# EasyEDA Pro project esp-college-project_bkymsryt-aeef78a5.epro, board PCB-ESP-SensairShuttle-MainBoard-V1_1
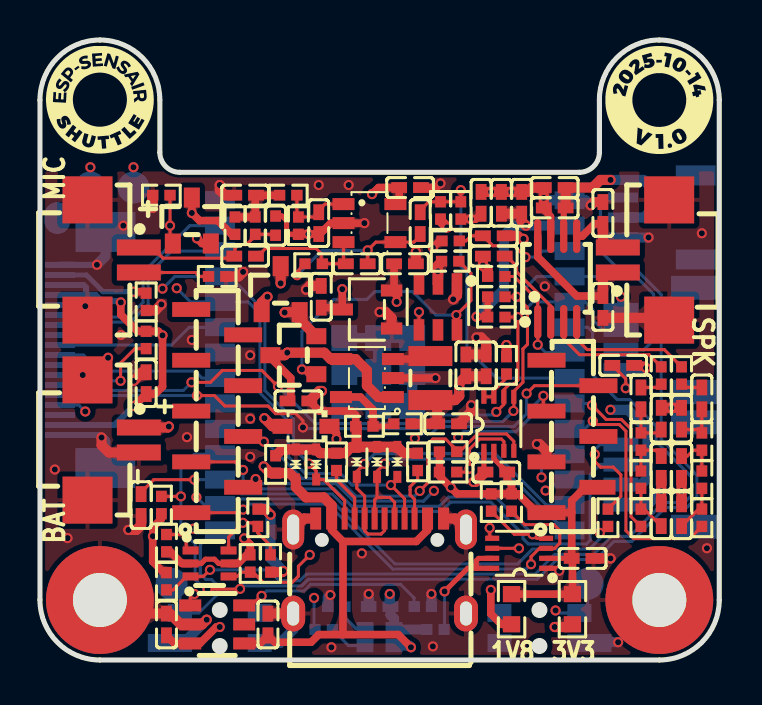
[diagram p7: board, top side]
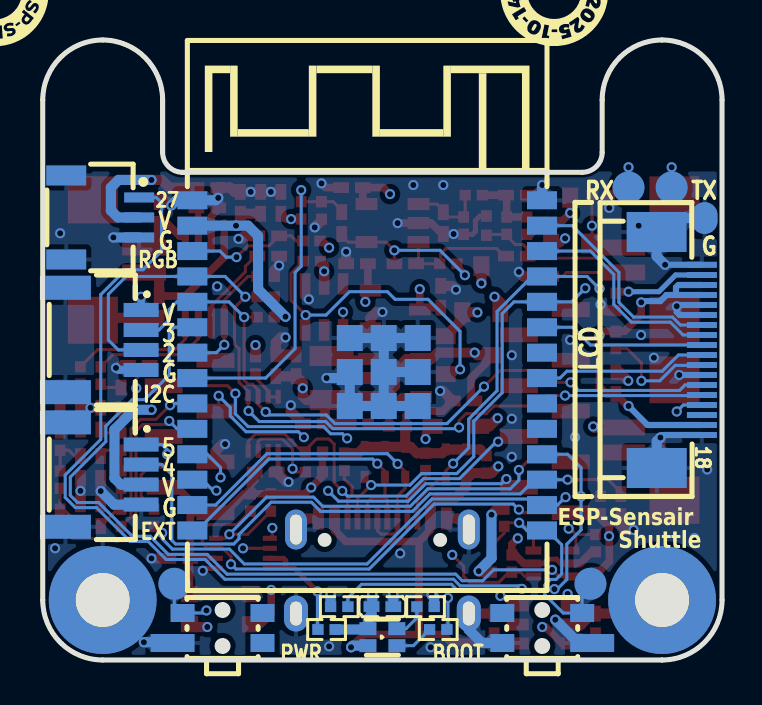
[diagram p8: board, bottom side, seen from below]

Outline 34 x 31 mm; copper layers: Top Layer, GND, POWER, Bottom Layer. Coordinates in mm from the lower left corner of the outline.
Outline path: 0,28 0,3 arc(0.88,0.88) 3,0 31,0 arc(33.12,0.88) 34,3 34,28 arc(33.12,30.12) 31,31 arc(28.88,30.12) 28,28 28,25.38 arc(27.71,24.68) 27,24.38 7,24.38 arc(6.29,24.68) 6,25.38 6,28 arc(5.12,30.12) 3,31 arc(0.88,30.12) 0,28
Stack: Top Layer 0.035mm 外层铜厚1oz / Dielectric1 0.28mm 7628 RC49% 8.6mil / GND 0.035mm 内层铜厚 / Dielectric2 0.28mm 1.1mm H/HOZ Copper / POWER 0.035mm 内层铜厚 / Dielectric3 0.28mm 7628 RC49% 8.6mil / Bottom Layer 0.035mm 外层铜厚1oz

## Design rules (mm)
spacing copperThickness1oz (default): track to track 0.102, other pairs 0.152 to 0.3
spacing copperThickness2oz: track to track 0.203, other pairs 0.152 to 0.3
spacing Plane_innerPlane: track to track 0.102, other pairs 0.152 to 0.3
spacing Copper_copperRegion: track to track 0.102, other pairs 0.152 to 0.3
track width copperThickness1oz (default): min 0.127, default 0.152, max 2.54
track width copperThickness2oz: min 0.203, default 0.254, max 2.54
track width power: min 0.127, default 0.381, max 2.54
track width maxpower: min 0.254, default 0.508, max 2.54
differential pair differentialPair (default): width min 0.127, default 0.254, max 2.54; gap min 0.152, default 0.152
net GND uses copperRegion_copperThickness1oz, maxpower
net VBUS uses maxpower
net VCC_3V3 uses maxpower
net VCC_1V8 uses power
net VDD_SENSOR uses power
net MIC_3V3 uses maxpower
net LEDK uses power
net VIN uses maxpower
net VBAT_IN uses maxpower
net AUDIO_3V3 uses power
net VOUT uses power
pour e1780 uses Copper_copperRegion, copperRegion_Copper_copperRegion
pour e1885 uses Copper_copperRegion, copperRegion_Copper_copperRegion
pour e1979 uses Copper_copperRegion, copperRegion_Copper_copperRegion
pour e2000 uses Copper_copperRegion, copperRegion_Copper_copperRegion

## Placement (name value [footprint] x y rotation side)
C1  15pF  [C0402]  15.86 19.81 0 top
C2  100nF  [C0402]  22.08 22.86 90 top
C3  100nF  [C0402]  18.52 23.62 0 top
C4  10uF  [C0402]  10.27 23.24 0 top
C5  4.7uF  [C0402]  13.95 21.84 90 top
C6  2.2uF  [C0402]  10.27 20.19 0 top
C7  4.7uF  [C0402]  19.03 21.84 270 top
C8  10uF  [C0402]  23.1 22.86 90 top
C9  100nF  [C0402]  24.11 22.86 270 top
C10  22pF  [C0402_1]  11.79 21.72 270 top
C11  1uF  [C0402]  22.72 21.21 0 top
C12  4.7nF  [C0402]  31.1 7.24 270 top
C13  2.2nF  [C0402]  31.1 9.65 90 top
C14  1nF  [C0402]  31.1 12.06 270 top
C15  1nF  [C0402]  28.18 17.65 270 top
C16  4.7nF  [C0402]  32.11 7.24 90 top
C17  2.2nF  [C0402]  32.11 9.65 270 top
C18  1nF  [C0402]  32.11 12.06 90 top
C19  1nF  [C0402]  28.18 22.35 270 top
C20  100nF  [C0402]  30.08 13.08 90 top
C21  1uF  [C0402]  22.72 20.19 0 top
C22  100nF  [C0402]  33.13 13.08 90 top
C23  100nF  [C0402]  25.76 22.61 0 top
C24  1uF  [C0402]  25.76 23.62 0 top
C26  10uF  [C0402]  21.32 14.73 270 top
C27  100nF  [C0402]  20.43 11.81 180 top
C28  10uF  [C0402]  14.08 18.16 270 top
C29  10uF  [C0402]  18.27 19.81 180 top
C30  100nF  [C0402]  22.33 14.73 270 top
C31  100nF  [C0402]  5.32 13.84 270 top
C32  10uF  [C0402]  6.33 1.78 270 top
C33  10uF  [C0402]  11.41 1.78 270 top
C34  100nF  [C0402]  22.84 9.4 0 top
C35  100nF  [C0402]  17 2.67 0 bottom
C36  100nF  [C0402]  27.16 5.08 180 top
C37  100nF  [C0402]  29.19 14.73 180 top
C38  100nF  [C0402]  5.06 7.75 90 top
C39  10uF  [C0402]  12.94 12.95 180 top
CN1  HC-1.25-2PWT  [CONN-SMD_2P-P1.25-HC-1.25-2PWT]  3.66 20 270 top
CN2  HC-1.25-2PWT  [CONN-SMD_2P-P1.25-HC-1.25-2PWT]  30.21 20 90 top
CN3  X1311FVS-09-C43D35R1  [HDR-SMD_9P-P1.27-V-F_R1]  8.87 12.45 90 top
CN4  HC-1.0-4PWT  [CONN-SMD_4P-P1.00_HCTL_HC-1.0-4PWT]  30.97 9.27 270 bottom
CN5  HC-1.0-4PWT  [CONN-SMD_4P-P1.00_HCTL_HC-1.0-4PWT]  30.97 16 270 bottom
CN6  HC-1.0-3PWT  [CONN-SMD_3P-P1.0-HC-1.0-3PWT]  31 22.13 270 bottom
CN7  HC-1.25-2PWT  [CONN-SMD_2P-P1.25-HC-1.25-2PWT]  3.66 11 270 top
D1  LESD5D5.0CT1G  [SOD-523_L1.2-W0.8-LS1.6-BI]  12.81 9.78 270 top
D2  LESD5D5.0CT1G  [SOD-523_L1.2-W0.8-LS1.6-BI]  16.87 9.91 270 top
D4  1N5819WS  [SOD-323_L1.8-W1.3-LS2.5-RD]  13.32 11.68 180 top
D5  LESD5D5.0CT1G  [SOD-523_L1.2-W0.8-LS1.6-BI]  15.86 9.91 270 top
D6  LESD5D5.0CT1G  [SOD-523_L1.2-W0.8-LS1.6-BI]  17.89 9.91 270 top
D7  LESD5D5.0CT1G  [SOD-523_L1.2-W0.8-LS1.6-BI]  13.82 9.78 270 top
L1  2.2uH  [IND-SMD_L2.5-W2.0_MHCHL2520]  19.54 14.1 90 top
LED1  A-SP1942R6GHC-A01-2T  [LED-SMD_4P-L1.6-W1.5_F.1615.00003-P4-1615R1G1TA2-06T-001]  17 1.14 0 bottom
NOREF  -  [Pad_e151]  27.41 3.81 0 top
NOREF#2  -  [Pad_e155]  0.87 22.1 0 top
NOREF#3  -  [Pad_e153]  2.52 23.62 0 top
NOREF#4  -  [Pad_e149]  3 3 0 top
NOREF#5  -  [Pad_e152]  6.59 3.81 0 top
NOREF#6  -  [Pad_e150]  31 3 0 top
NOREF#7  -  [Pad_e154]  4.68 23.62 0 top
Q1  AO3401A  [SOT-23_L2.9-W1.3-P1.90-LS2.4-BR]  12.05 18.54 270 top
Q2  AO3401A  [SOT-23_L2.9-W1.3-P1.90-LS2.4-BR]  7.6 21.97 270 top
Q3  LBSS138DW1T1G  [SC-88-6_L2.0-W1.3-P0.65-LS2.1-BL]  8.49 4.83 270 top
Q4  AO3401A  [SOT-23_L2.9-W1.3-P1.90-LS2.4-BR]  12.68 15.24 0 top
R1  2.2kΩ  [R0402]  22.84 17.14 0 top
R2  2.2kΩ  [R0402]  22.84 18.16 0 top
R3  100kΩ  [R0402_1]  12.43 23.24 0 top
R4  150kΩ  [R0402]  13.7 19.81 180 top
R5  56kΩ  [R0402]  21.06 22.48 270 top
R6  1.5kΩ  [R0402]  9.76 21.72 90 top
R7  2.2kΩ  [R0402]  10.78 21.72 90 top
R8  100kΩ  [R0402_1]  12.94 21.72 90 top
R9  8.2kΩ  [R0402]  20.05 22.48 90 top
R10  0Ω  [R0402_1]  8.87 19.18 180 top
R11  10kΩ  [R0402_1]  6.08 7.75 90 top
R12  10kΩ  [R0402_1]  10.9 7.11 270 top
R13  10kΩ  [R0402_1]  20.56 20.95 0 top
R14  0Ω(NC)  [R0402_1]  28.43 7.11 90 top
R15  1kΩ  [R0402]  30.08 7.11 90 top
R16  1kΩ  [R0402]  30.08 9.02 90 top
R17  1kΩ  [R0402]  30.08 10.92 90 top
R18  1kΩ  [R0402]  33.13 7.11 90 top
R19  1kΩ  [R0402]  33.13 9.02 90 top
R20  1kΩ  [R0402]  33.13 10.92 90 top
R21  10kΩ  [R0402_1]  22.84 19.18 0 top
R22  51kΩ  [R0402]  31.1 14.22 90 top
R23  51kΩ  [R0402]  32.11 14.22 90 top
R24  5.1kΩ  [R0402]  14.84 9.91 270 top
R25  100kΩ  [R0402_1]  18.14 11.81 180 top
R26  2MΩ  [R0402]  20.53 19.94 180 top
R27  5.1kΩ  [R0402]  18.91 9.91 270 top
R28  10kΩ  [R0402]  11.79 9.78 90 top
R29  22.1kΩ  [R0402_1]  16.24 11.68 180 top
R30  10Ω  [R0402_1]  5.32 17.91 90 top
R31  4.7kΩ  [R0402]  20.43 10.41 0 top
R32  4.7kΩ  [R0402]  20.43 9.4 0 top
R33  200kΩ  [R0402]  23.35 14.73 90 top
R34  5.1kΩ  [R0402]  19.16 2.67 0 bottom
R35  10kΩ  [R0402_1]  5.32 16 270 top
R36  1.5kΩ  [R0402]  14.21 1.52 0 bottom
R37  4.7kΩ  [R0402]  14.84 2.67 0 bottom
R38  4.7kΩ  [R0402]  22.59 7.87 270 top
R39  4.7kΩ  [R0402]  23.6 7.87 270 top
R40  200kΩ  [R0402]  19.79 1.52 180 bottom
R41  10kΩ  [R0402_1]  6.33 5.84 270 top
R42  10kΩ  [R0402_1]  11.54 4.83 270 top
R43  10MΩ  [R0402]  6.08 23.24 180 top
R44  10kΩ  [R0402_1]  10.52 4.83 90 top
R45  10kΩ  [R0402_1]  6.33 3.94 90 top
R46  0Ω  [R0603]  26.65 2.54 90 top
R47  0Ω(NC)  [R0603]  23.6 2.54 90 top
SW1  TS-1186F-C-A  [KEY-SMD_TS-1186F-C-A#2]  9 1.6 0 bottom
SW2  TS-1186F-C-A  [KEY-SMD_TS-1186F-C-A]  25 1.6 0 bottom
U1  ESP32-C5-WROOM-1-N16R8  [SMT-ESP32-C5-WROOM-1]  17.76 14.73 180 bottom
U2  LMV321IDBVR  [SOT-23-5_L3.0-W1.7-P0.95-LS2.8-BR_1]  16.49 21.84 180 top
U3  NS4150B  [MSOP-8_L3.0-W3.0-P0.65-LS5.0-BL]  25.89 19.05 0 top
U4  TLV62569DBVR  [SOT-23-5_L3.0-W1.7-P0.95-LS2.8-BR]  16.37 14.1 0 top
U5  SAM8108  [SOT-23-6_L2.9-W1.6-P0.95-LS2.8-BL]  19.92 17.65 180 top
U6  XC6206P182MR(1uA)  [SOT-23-3_L2.9-W1.6-P1.90-LS2.8-BR]  16.37 17.53 0 top
U7  TP4057  [SOT-23-6_L2.9-W1.6-P0.95-LS2.8-BR]  8.87 1.78 180 top
U8  PCA9306DCUR  [SSOP-8_L2.0-W2.3-P0.50-LS3.1-BR]  22.97 11.81 270 top
U9  X1311FVS-07-C43D35R1  [HDR-SMD_7P-P1.27-V-F-LS3.5_XKB_R1]  26.65 11.18 90 top
U10  PCA9306DCUR  [SSOP-8_L2.0-W2.3-P0.50-LS3.1-BR]  23.99 5.33 0 top
USB1  TYPE-C 16PIN 2MD(073)  [USB-C-SMD_TYPE-C-6PIN-2MD-073]  17 4.7 0 top
X1  AFC07-S18ECA-00  [FPC-SMD_AFC07-S18ECA-00]  2.14 15.5 270 bottom

## Footprints (pads in the part's own frame, mm; a bottom-side part is the same pattern mirrored in y, then rotated)
C0402
  rect 0.79x0.54 smd: 1(-0.545,0) 2(0.545,0)
C0402_1
  rect 0.566x0.54 smd: 1(-0.481,0) 2(0.481,0)
CONN-SMD_2P-P1.25-HC-1.25-2PWT
  rect 0.8x2.2 smd: 1(-0.625,1.285) 2(0.625,1.285)
  rect 2.35x2.5 smd: 3(-3.005,-1.285) 4(3.005,-1.285)
CONN-SMD_3P-P1.0-HC-1.0-3PWT
  rect 0.5x1.5 smd: 1(-1,1.825) 2(0,1.825) 3(1,1.825)
  rect 1x2 smd: 4(-2.1,-1.825) 5(2.1,-1.825)
CONN-SMD_4P-P1.00_HCTL_HC-1.0-4PWT
  rect 0.7x1.75 smd: 1(-1.5,1.895) 2(-0.5,1.895) 3(0.5,1.895) 4(1.5,1.895)
  rect 1.2x2.55 smd: 5(2.61,-1.895) 6(-2.61,-1.895)
FPC-SMD_AFC07-S18ECA-00
  rect 0.3x1.5 smd: 1(-4.26,1.133) 2(-3.75,1.133) 3(-3.25,1.133) 4(-2.75,1.133) 5(-2.25,1.133) 6(-1.75,1.133) 7(-1.25,1.133) 8(-0.75,1.133) 9(-0.25,1.133) 10(0.25,1.133) 11(0.75,1.133) 12(1.25,1.133) 13(1.75,1.133) 14(2.25,1.133) 15(2.75,1.133) 16(3.25,1.133) 17(3.75,1.133) 18(4.25,1.133)
  rect 2x3 smd: 19(5.901,-1.127) 20(-5.901,-1.133)
HDR-SMD_7P-P1.27-V-F-LS3.5_XKB_R1
  rect 0.74x1.9 smd: 1(-3.81,1.3) 3(-1.27,1.3) 4(0,-1.3) 5(1.27,1.3) 6(2.54,-1.3) 7(3.81,1.3)
  rect 0.74x1.8 smd: 2(-2.54,-1.25)
HDR-SMD_9P-P1.27-V-F_R1
  rect 0.74x1.9 smd: 1(-5.08,1.3) 2(-3.81,-1.3) 3(-2.54,1.3) 4(-1.27,-1.3) 5(0,1.3) 6(1.27,-1.3) 7(2.54,1.3) 8(3.81,-1.3) 9(5.08,1.3)
IND-SMD_L2.5-W2.0_MHCHL2520
  rect 1x2.2 smd: 1(-1.1,0) 2(1.1,0)
KEY-SMD_TS-1186F-C-A
  rect 1.2x0.9 smd: 1(-2,0.75) 3(-2,-0.75) 4(2,-0.75)
  rect 2.2x0.9 smd: 2(2.5,0.75)
KEY-SMD_TS-1186F-C-A#2
  rect 2.2x0.9 smd: 1(-2.5,0.75)
  rect 1.2x0.9 smd: 2(2,0.75) 3(-2,-0.75) 4(2,-0.75)
LED-SMD_4P-L1.6-W1.5_F.1615.00003-P4-1615R1G1TA2-06T-001
  rect 0.85x0.65 smd: 1(-0.725,-0.425) 2(-0.725,0.425) 3(0.725,0.425) 4(0.725,-0.425)
MSOP-8_L3.0-W3.0-P0.65-LS5.0-BL
  oval 0.364x1.692 smd: 1(-0.975,-2.146) 2(-0.325,-2.146) 3(0.325,-2.146) 4(0.975,-2.146) 5(0.975,2.146) 6(0.325,2.146) 7(-0.325,2.146) 8(-0.975,2.146)
Pad_e149
  round 5.4 hole 2.7: 0(0,0)
Pad_e150
  round 5.4 hole 2.7: 0(0,0)
Pad_e151
  round 1.6 smd far side: 1(0,0)
Pad_e152
  round 1.6 smd far side: 1(0,0)
Pad_e153
  round 1.6 smd far side: 1(0,0)
Pad_e154
  round 1.6 smd far side: 1(0,0)
Pad_e155
  rrect 1.3x1.6 smd far side: 1(0,0)
R0402
  rect 0.566x0.54 smd: 1(-0.433,0) 2(0.433,0)
R0402_1
  rect 0.566x0.54 smd: 1(-0.433,0) 2(0.433,0)
R0603
  rect 0.806x0.864 smd: 1(-0.753,0) 2(0.753,0)
SC-88-6_L2.0-W1.3-P0.65-LS2.1-BL
  rect 0.4x0.8 smd: 1(-0.65,-0.95) 2(0,-0.95) 3(0.65,-0.95) 4(0.65,0.95) 5(0,0.95) 6(-0.65,0.95)
SMT-ESP32-C5-WROOM-1
  rect 1.5x0.9 smd: 1(-8.75,8.255) 2(-8.75,6.985) 3(-8.75,5.715) 4(-8.75,4.445) 5(-8.75,3.175) 6(-8.75,1.905) 7(-8.75,0.635) 8(-8.75,-0.635) 9(-8.75,-1.905) 10(-8.75,-3.175) 11(-8.75,-4.445) 12(-8.75,-5.715) 13(-8.75,-6.985) 14(-8.75,-8.255) 15(8.75,-8.255) 16(8.75,-6.985) 17(8.75,-5.715) 18(8.75,-4.445) 19(8.75,-3.175) 20(8.75,-1.905) 21(8.75,-0.635) 22(8.75,0.635) 23(8.75,1.905) 24(8.75,3.175) 25(8.75,4.445) 26(8.75,5.715) 27(8.75,6.985) 28(8.75,8.255)
  rect 1.3x1.3 smd: 29(-0.87,1.367) 30(0.83,1.367) 31(2.53,1.367) 32(-0.87,-0.333) 33(0.83,-0.333) 34(2.53,-0.333) 35(-0.87,-2.033) 36(0.83,-2.033) 37(2.53,-2.033)
SOD-323_L1.8-W1.3-LS2.5-RD
  rect 1x0.75 smd: 1(-1.173,0) 2(1.173,0)
SOD-523_L1.2-W0.8-LS1.6-BI
  rect 0.6x0.4 smd: 1(-0.75,0) 2(0.75,0)
SOT-23-3_L2.9-W1.6-P1.90-LS2.8-BR
  rect 1.07x0.6 smd: 1(1.235,-0.95) 2(1.235,0.95) 3(-1.235,0)
SOT-23-5_L3.0-W1.7-P0.95-LS2.8-BR
  rect 1.1x0.6 smd: 1(1.3,-0.95) 2(1.3,0) 3(1.3,0.95) 4(-1.3,0.95) 5(-1.3,-0.95)
SOT-23-5_L3.0-W1.7-P0.95-LS2.8-BR_1
  rect 1.1x0.6 smd: 1(1.3,-0.95) 2(1.3,0) 3(1.3,0.95) 4(-1.3,0.95) 5(-1.3,-0.95)
SOT-23-6_L2.9-W1.6-P0.95-LS2.8-BL
  rect 0.532x1.072 smd: 1(-0.95,-1.149) 2(0,-1.149) 3(0.95,-1.149) 4(0.95,1.149) 5(0,1.149) 6(-0.95,1.149)
SOT-23-6_L2.9-W1.6-P0.95-LS2.8-BR
  rect 1.1x0.6 smd: 1(1.35,-0.95) 2(1.35,0) 3(1.35,0.95) 4(-1.35,0.95) 5(-1.35,0) 6(-1.35,-0.95)
SOT-23_L2.9-W1.3-P1.90-LS2.4-BR
  rect 1x0.8 smd: 1(1.15,-0.95) 2(1.15,0.95) 3(-1.15,0)
SSOP-8_L2.0-W2.3-P0.50-LS3.1-BR
  rect 0.7x0.26 smd: 1(1.35,-0.75) 2(1.35,-0.25) 3(1.35,0.25) 4(1.35,0.75) 5(-1.35,0.75) 6(-1.35,0.25) 7(-1.35,-0.25) 8(-1.35,-0.75)
USB-C-SMD_TYPE-C-6PIN-2MD-073
  rect 0.55x1.1 smd: 1(-3.2,2.375) 2(-2.4,2.375) 11(2.4,2.375) 12(3.2,2.375)
  rect 0.3x1.1 smd: 3(-1.75,2.375) 4(-1.25,2.375) 5(-0.75,2.375) 6(-0.25,2.375) 7(0.25,2.375) 8(0.75,2.375) 9(1.25,2.375) 10(1.75,2.375)
  oval 1.1x2 hole 0.6x1.5: 13(-4.325,1.825) 14(4.325,1.825)
  oval 1.2x1.8 hole 0.6x1.2: 13(-4.325,-2.375) 14(4.325,-2.375)

## Nets
As in the schematic, except:
GND: C2.2 C3.2 C4.1 C5.1 C8.2 C9.1 C10.1 C11.2 C12.1 C13.1 C14.1 C15.2 C16.2 C17.2 C18.2 C19.1 C21.1 C23.1 C24.1 C26.1 C27.1 C28.1 C29.1 C30.1 C31.1 C32.1 C33.1 C34.1 C35.1 C36.1 C37.1 C38.1 C39.1 CN1.3 CN1.4 CN2.3 CN2.4 CN4.4 CN4.5 CN4.6 CN5.4 CN5.5 CN5.6 CN6.3 CN6.4 CN6.5 CN7.2 CN7.3 CN7.4 D1.1 D2.1 D5.1 D6.1 D7.1 NOREF#2.1 NOREF#4.0 NOREF#6.0 R8.1 R9.1 R10.1 R21.1 R24.1 R27.1 R28.2 R29.2 R30.1 R34.2 R37.1 R43.2 SW1.1 SW1.2 SW2.2 U1.1 U1.28 U1.29 U1.30 U1.31 U1.32 U1.33 U1.34 U1.35 U1.36 U1.37 U2.2 U3.7 U4.2 U5.1 U6.1 U7.2 U8.1 U9.3 U10.1 USB1.1 USB1.12 USB1.13 USB1.14 X1.1 X1.5 X1.6 X1.12 X1.18 X1.19 X1.20
BM_G1: NOREF#5.1 Q3.6 R12.2 R42.1 SW1.3 U1.15
ESP_RX0: D6.2 NOREF#7.1 U1.24 USB1.9
ESP_TX0: D7.2 NOREF#3.1 U1.25 USB1.3
$1N51545: NOREF.1 SW2.4 U5.4

Pads without a net: CN3 5 6 7 8 9; SW1 4; SW2 1 3; U1 19 20 22; U5 3 5; U7 5; U9 4 7; X1 16

## Via types
v1: diameter 0.508, hole 0.305, Top Layer to Bottom Layer, 159 vias
v2: diameter 0.5, hole 0.305, Top Layer to Bottom Layer, 1 via

## Routing (per net, layer and track width the routed paths; a pad name or vN(x,y) marks a point on that pad's centre or on a via; arc(x,y) is an arc through that point)
GND: length 112.9
  Top Layer w0.254: U10.1 25.87,4.58 v1(25.99,4.46) ; R8.1 12.48,21.28 12.34,21.42 12.34,21.97 12.11,22.2 C10.1 ; 22.3,9.4 22.22,9.48 22.22,10.46
  Top Layer w0.355: U3.7 25.56,22.17 25.22,22.52 C23.1
  Top Layer w0.381: R8.1 12.95,21.3 v1(13.44,21.3) 14.01,21.3 14.56,21.84 U2.2 v1(16.24,21.84) ; C3.2 19.84,23.62 v1(20.05,23.83) ; C39.1 13.99,12.45 15.6,12.45 15.81,12.24 R29.2 ; 17.66,14.1 v1(19.79,14.1) ; C37.1 30.21,14.73 30.26,14.68
  Top Layer w0.508: 20.87,18.8 20.87,18.22 v1(20.68,18.03) ; v1(24.87,10.8) 25,10.8 25.35,10.44 U9.3 ; USB1.1 13.22,7.07 USB1.13 ; C14.1 v1(31.61,12.61) C18.2 ; v1(4.43,6.5) 4.82,6.5 5.06,6.74 C38.1 ; v1(21.85,16.13) 22.08,16.13 22.33,15.88 C30.1 C26.1 ; R30.1 5.77,17.47 v1(6.08,17.78) ; 22.3,9.4 21.8,8.9 v1(21.7,8.9) ; C15.2 31.38,17.11 CN2.3 ; v1(18.81,20.41) C29.1 ; C4.1 9.25,23.24 9,23.5 v1(9,23.75) ; C21.1 v1(22.17,19.72) 22.41,19.48 22.41,19.18 ; CN7.2 3.45,10.38 3.08,10.74 v1(3.08,11.12) ; v1(4.7,13.96) 5.13,14.39 C31.1 ; C2.2 v1(22.58,23.41) C8.2 v1(23.59,23.41) C9.1 24.4,23.41 24.62,23.62 C24.1 v1(25.22,23.11) C23.1 ; v1(10.17,19.4) 9.94,19.18 R10.1 ; C16.2 v1(32.11,8.45) C17.2 ; v1(14.11,13.45) 13.98,13.45 C39.1 ; R9.1 20.05,21.97 v1(20.39,21.63) ; U6.1 17.6,17.1 17.3,17.4 v1(17,17.4) ; D5.1 D2.1 D6.1 18.21,10.34 R27.1 ; D5.1 15.86,11.63 R29.2 ; D5.1 15.59,10.66 15.27,10.34 R24.1 14.01,10.34 D7.1 D1.1 12.11,10.53 R28.2 ; v1(27.57,22.73) 27.73,22.9 C19.1 ; USB1.12 20.78,7.07 USB1.14 ; C28.1 13.51,18.71 v1(13.32,18.52) ; C11.2 23.9,21.21 24.05,21.06 v1(24.2,21.06) ; v1(8.35,2.01) 8.11,1.78 U7.2 7.05,1.78 6.5,2.32 C32.1 3.68,2.32 NOREF#4.0 ; v1(21.59,12.74) 21.59,12.42 C27.1 ; C36.1 v1(28.56,5.08) ; C13.1 v1(31.1,8.45) C12.1 ; v1(5.65,22.61) R43.2 ; C33.1 12.67,2.32
  Bottom Layer w0.305: X1.12 v1(2.14,14.25) ; X1.5 2.21,17.75 v1(2.27,17.69) 2.27,17.4 2.12,17.25 X1.6 ; X1.1 v1(2.85,19.76) ; X1.18 2.96,11.25 v1(3.08,11.12)
  Bottom Layer w0.381: v1(30.34,14.61) 30.23,14.5 CN5.4
  Bottom Layer w0.508: USB1.13 12.68,1.52 12.01,0.85 SW1.2 ; U1.36 U1.35 U1.32 18.93,14.1 v1(19.79,14.1) ; U1.36 U1.33 ; U1.36 U1.37 ; U1.33 U1.30 ; U1.33 U1.34 ; v1(19.59,3.3) R34.2 ; v1(8.35,2.01) 7.18,0.85 SW1.1 ; U1.30 U1.29 ; U1.30 U1.31 ; v1(27.57,22.73) 27.31,22.99 U1.1 25.34,22.99 v1(25.22,23.11) ; X1.19 3.27,10.94 v1(3.08,11.12) ; v1(16.46,3.3) C35.1 ; v1(28.94,0.89) 27.54,0.89 SW2.2 ; R37.1 14.41,3.12 v1(14.53,3.25) ; v1(2.85,19.76) 3.27,20.18 X1.20 2.58,22.1 NOREF#2.1 ; v1(9,23.75) 9,23 U1.28 ; CN4.4 30.42,7.77 v1(31.1,8.45) ; CN6.3 v1(30.46,21.13)
  vias: v1(0.74,9.53) v1(1.38,6.1) v1(3.41,15.11) v1(4.05,16.25) v1(4.17,21.72) v1(7.36,11.14) v1(7.6,16) v1(10.52,15.24) v1(10.52,12.06) v1(10.52,10.16) v1(13.95,23.75) v1(14.59,0.64) v1(15.45,23.75) v1(16.11,5.33) v1(19.67,0.68) v1(25.27,18.68) v1(33.13,21.34) v1(33.38,5.59)
VBAT_IN: length 33.2
  Top Layer w0.381: v1(9,1.65) 8.83,1.65 8,0.83 U7.3 6.74,0.83 C32.2
  Top Layer w0.508: CN7.1 6.4,11.62 v1(6.45,11.67) ; v1(12.05,18.83) Q1.3
  POWER w0.381: v1(9,1.65) 8.87,1.65 8.49,1.27 7.6,1.27 6.84,2.03 6.84,4.17 5.06,5.95 5.06,6.73 5.69,7.35 7.94,7.35 8.43,7.84 8.43,9.16 6.45,11.14 v1(6.45,11.67)
  POWER w0.508: v1(12.05,18.83) 11.13,18.83 9.95,17.65 8.12,17.65 6.84,16.37 6.84,12.06 v1(6.45,11.67)
VBUS: length 36.7
  Top Layer w0.381: v1(18.57,0.64) 17.94,1.27 15.17,1.27 ; 15.17,5.93 18.83,5.93 19.4,6.49 USB1.11 ; 15.17,5.93 14.59,6.51 ; 15.17,5.93 15.17,1.27 ; 15.17,1.27 13.95,1.27 13.57,0.89 11.76,0.89 C33.2 11.01,0.83 U7.4
  Top Layer w0.508: Q1.1 11.1,17.87 v1(11.39,18.16) ; v1(11.2,9.68) 11.53,9.35 R28.1 12.49,9.35 D1.2 12.81,8.64 13.32,8.13 14.21,8.13 14.6,7.73 USB1.2 ; v1(11.23,12.09) 11.64,11.68 D4.2
  POWER w0.508: v1(11.2,9.68) 11.92,10.4 11.92,11.4 v1(11.23,12.09) 11.23,18.01 v1(11.39,18.16)
  Bottom Layer w0.508: LED1.3 18.49,0.72 v1(18.57,0.64)
VCC_1V8: length 21.9
  Top Layer w0.381: 17.72,19.81 17.72,18.6 U6.2 17.85,18.22 v1(17.85,17.91) ; v1(22.57,3.5) 22.57,2.31 23.09,1.79 R47.1
  POWER w0.381: v1(22.57,3.5) 23.1,4.04 23.1,9.91 20.56,12.46 19.64,12.46 17.85,14.25 v1(17.85,17.91)
VCC_3V3: length 109.6
  Top Layer w0.305: v1(21.85,17.16) 22.39,17.16 22.41,17.14 22.41,18.16
  Top Layer w0.381: v1(15.13,18.54) U6.3 15.04,17.62 C28.2 ; v1(19.67,20.61) 20.01,20.95 R13.1 ; R45.2 6.27,4.43 6.13,4.43 5.64,4.92 5.64,6.18 v1(5.66,6.19) 5.66,6.64 6.08,7.06 R11.1 ; Q2.2 8.12,20.82 v1(7.86,21.08)
  Top Layer w0.508: R46.1 26.52,1.65 v1(25.76,1.65) ; C8.1 C9.2 24.11,21.93 v1(24.33,21.72) ; R42.2 12.13,4.39 v1(12.18,4.44) ; v1(11.54,7.27) 11.26,7.55 R12.1 ; R25.1 C27.2 19.88,12.65 L1.1 20.78,13 20.99,13.2 v1(20.99,13.59) 20.99,13.86 C26.2 C30.2 ; R33.2 v1(23.35,15.75)
  POWER w0.508: 23.35,14.61 v1(23.35,15.75) ; 23.35,14.61 27.16,14.61 28.56,13.21 v1(28.56,12.51) 28.56,11.68 27.92,11.05 27.41,11.05 26.91,10.54 26.91,2.41 26.14,1.65 v1(25.76,1.65) 23.1,1.65 22.21,0.76 20.68,0.76 18.14,3.3 v1(17.51,3.3) 16.69,4.11 12.51,4.11 v1(12.18,4.44) 11.2,5.42 6.43,5.42 v1(5.66,6.19) ; 23.35,14.61 22.33,13.59 v1(20.99,13.59) 20.99,16.3 v1(21.85,17.16) ; v1(7.86,21.08) 8.32,20.61 15.14,20.61 ; v1(15.13,18.54) 15.14,18.55 15.14,20.61 ; v1(24.33,21.72) 23.48,21.72 22.38,20.61 v1(19.67,20.61) 19.14,21.14 15.66,21.14 15.14,20.61
  Bottom Layer w0.508: 19.36,1.52 17.77,1.52 LED1.4 17.72,2.07 17.54,2.25 C35.2 17.51,2.7 v1(17.51,3.3) ; v1(11.54,7.27) 11.54,5.09 v1(12.18,4.44) ; U1.2 v1(24.33,21.72) 23.73,21.72 23.22,21.21 23.22,18.54 v1(21.85,17.16) ; v1(28.56,12.51) 29.42,12.51 30.41,11.52 30.41,9.09 30.09,8.77 CN4.3
VDD_SENSOR: length 40.2
  Top Layer w0.254: 22.72,10.46 22.72,10.07 C34.2 ; 26.61,5.08 U10.2 ; 7.54,4.83 8.07,4.83 8.29,5.04 8.73,5.04 8.94,4.83 Q3.5
  Top Layer w0.381: R31.1 R32.1 20,9.2 v1(20.57,8.63) 20.88,8.31 R38.1 R39.1 ; C34.2 23.39,8.98 23.6,8.76 R39.1 ; 7.54,4.83 7.11,4.83 6.52,5.41 R41.2 ; Q3.5 9.92,4.83 10.35,5.26 R44.2 10.52,5.78 v1(10.22,6.08) ; R39.1 23.93,8.31 24.87,7.37 U9.1 26.59,7.37 26.62,7.39 ; 26.62,7.39 26.62,7.96 27.29,8.64 27.95,8.64 ; 26.62,7.39 C36.2 26.65,5.04 R46.2 R47.2
  POWER w0.381: v1(20.57,8.63) 20.57,8.31 16.91,4.66 12.82,4.66 11.4,6.08 v1(10.22,6.08)
VIN: length 12.7
  Top Layer w0.508: v1(12.25,17.38) 12.26,17.39 Q1.2 13,17.03 Q4.2 ; v1(19.92,19.44) 19.92,18.81 U5.2 19.92,19.73 20.12,19.92
  POWER w0.508: v1(12.25,17.38) 15.07,17.38 17.13,19.43 19.91,19.43 v1(19.92,19.44)
AUDIO_3V3: length 45.5
  Top Layer w0.381: R5.2 21.81,22.05 C2.1 ; v1(16.62,23.29) 16.95,23.62 C3.1 17.98,22.98 U2.5 ; v1(4.68,12.7) 4.72,12.7 C31.2 5.76,13.3 6.13,13.67 v1(6.13,16.23) 5.93,16.44 R35.1 4.88,16.44 4.05,17.27 v1(4.05,17.88) ; R6.1 9.74,21.27 9.61,21.27 8.9,21.97 7.98,21.97 v1(7.6,22.35) 7.6,23.12
  POWER w0.381: v1(21.57,22.05) 21.01,22.61 19.29,22.61 18.6,23.29 v1(16.62,23.29) 15.68,22.35 v1(7.6,22.35) 7.22,21.97 7.22,19.56 7.77,19.01 7.77,18.08 6.13,16.44 v1(6.13,16.23)
  Bottom Layer w0.305: v1(4.68,12.7) 3.73,11.75 X1.17 ; v1(4.05,17.88) 3.98,17.94 3.09,17.94 2.78,18.25 2.31,18.25 ; X1.4 2.31,18.25 ; 2.31,18.25 2.31,18.63 2.19,18.75 X1.3
BM_CS: length 6.2
  Top Layer w0.152: U10.6 v1(23.98,5.58)
  GND w0.152: v1(23.98,5.58) 23.98,7.14 v1(25.31,8.47)
  Bottom Layer w0.152: v1(25.31,8.47) 25.47,8.47 26.02,9.02 U1.12
BM_G1: length 13.7
  Top Layer w0.152: Q3.6 9.44,6.14 v1(10.16,6.86) 10.72,6.86 10.9,6.68 10.9,6.35 11.54,5.72 R42.1
  Bottom Layer w0.152: NOREF#5.1 7,3.4 SW1.3 7.95,2.35 8.87,3.27 8.87,3.74 8.59,4.03 8.31,4.03 8.03,4.31 8.03,5.76 8.75,6.48 U1.15 9.76,6.48 10.14,6.86 v1(10.16,6.86)
BM_G2: length 40.5
  Top Layer w0.152: R45.1 6.66,3.5 7.33,4.18 8.18,4.18 v1(8.51,4.51)
  Bottom Layer w0.152: v1(8.51,4.51) 11.44,4.51 11.98,3.96 13,3.96 13.33,4.29 24.78,4.29 25.77,5.28 27.72,5.28 28.62,6.19 29.51,6.19 31.2,7.87 32.26,7.87 32.62,8.23 32.62,9.14 30.84,10.92 30.84,11.7 29.52,13.02 28.9,13.02 27.67,14.25 27.67,16.38 27.41,16.64 U1.6
BM_SCK/SCL: length 36
  Top Layer w0.152: v1(11.91,13.67) 11.11,14.48 9.13,14.48 8.53,13.88 v1(7.58,13.88) ; v1(22.84,12.41) 23.22,12.78 23.22,13.51 23.5,13.79 23.71,13.79 23.92,13.99 v1(23.92,17.14) R1.2
  Bottom Layer w0.152: v1(7.58,13.88) 7.18,13.48 2.13,13.48 1.85,13.75 X1.13 ; v1(23.92,17.14) 24.68,17.91 U1.5 27.29,17.91 27.67,17.53 27.67,17.02 28.18,16.5 CN5.2 ; v1(22.84,12.41) 22.69,12.25 19.81,12.25 19.38,11.82 13.76,11.82 v1(11.91,13.67)
BM_SDI/SDA: length 42.5
  Top Layer w0.152: v1(7.86,13.22) 8.73,13.22 9.25,12.7 11.41,12.7 11.79,12.32 12.81,12.32 13.16,11.96 v1(13.16,11.63) ; R2.2 v1(23.86,18.16) 24.4,17.62 24.4,15.78 24.17,15.56 24.17,13.89 23.72,13.43 23.72,12.48 v1(23.7,12.45)
  Bottom Layer w0.152: CN5.3 30.22,15.5 30.72,16 30.72,18.29 29.83,19.18 U1.4 24.87,19.18 v1(23.86,18.16) ; v1(23.7,12.45) 23.17,11.92 19.84,11.92 19.48,11.57 13.22,11.57 v1(13.16,11.63) ; X1.14 1.04,13.22 v1(7.86,13.22)
BM_SDO: length 6.4
  Top Layer w0.152: v1(22.51,6.6) 22.51,6.21 U10.5
  GND w0.152: v1(25.1,9.13) 25.03,9.13 v1(22.51,6.6)
  Bottom Layer w0.152: U1.11 25.76,10.29 25.1,9.63 v1(25.1,9.13)
CHRG: length 10.5
  Top Layer w0.152: U7.1 7.52,3.09 v1(7.73,3.3)
  POWER w0.152: v1(13.72,3.11) 13.14,3.68 12.26,3.68 10.95,4.99 8.15,4.99 7.73,4.57 v1(7.73,3.3)
  Bottom Layer w0.152: v1(13.72,3.11) 13.72,1.58 R36.1
CS: length 24.2
  Top Layer w0.152: v1(24.58,4.79) 24.58,5.17 25,5.58 U10.3 25.76,5.58 26.02,5.84 26.02,6.48 25.73,6.77 24.27,6.77 23.6,7.43 R39.2 ; v1(10.17,7.52) 10.01,7.37 CN3.1
  Bottom Layer w0.152: v1(10.17,7.52) 10.45,7.8 14.41,7.8 17.66,4.55 24.34,4.55 v1(24.58,4.79)
ESP_EN: length 6.2
  Top Layer w0.152: R13.2 21.32,20.95 21.57,21.21 C11.1 22.67,20.71 23.73,20.71 v1(24.3,20.14)
  Bottom Layer w0.152: v1(24.3,20.14) 24.82,20.14 25.13,20.45 U1.3
ESP_RX0: length 28.6
  Top Layer w0.152: D6.2 17.89,9.07 v1(17.57,8.75) 18.25,8.06 USB1.9
  POWER w0.152: v1(4.68,24.64) 4.68,20.75 v1(6.85,18.59)
  Bottom Layer w0.152: v1(6.85,18.59) 7.53,17.91 U1.24 10.42,17.91 11,17.32 11,13.36 12.43,11.94 12.43,10.17 13.28,9.32 15.04,9.32 15.62,8.75 v1(17.57,8.75) ; v1(4.68,24.64) NOREF#7.1
ESP_TX0: length 26.9
  Top Layer w0.152: v1(13.46,9.82) 13.82,9.45 D7.2 13.84,9.02 14.21,9.02 15.25,7.97 USB1.3
  POWER w0.152: v1(2.52,24.64) 2.52,22.18 v1(6.13,18.57)
  Bottom Layer w0.152: v1(2.52,24.64) NOREF#3.1 ; v1(13.46,9.82) 12.68,10.6 12.68,12.04 11.26,13.47 11.26,17.42 9.51,19.18 U1.25 6.75,19.18 6.14,18.57 v1(6.13,18.57)
EXT_IO1: length 29.8
  Top Layer w0.152: C38.2 5.06,8.38 5.7,9.02 v1(7.73,9.02)
  Bottom Layer w0.152: v1(7.73,9.02) U1.17 9.38,9.02 10.09,8.31 14.62,8.31 15.5,7.43 20.09,7.43 20.55,7.89 22.57,7.89 24.18,6.28 24.18,6.07 24.44,5.8 27.36,5.8 27.54,5.98 27.54,9.27 28.05,9.78 29.07,9.78 CN4.2
EXT_IO2: length 10.9
  Top Layer w0.152: v1(27.77,10.29) 27.77,9.93 28.06,9.64 28.69,9.64 29.07,9.26 29.07,8.19 R14.2 ; C37.2 29.32,14.06 v1(29.32,13.59)
  POWER w0.152: v1(29.32,13.59) 29.32,11.83 v1(27.77,10.29)
  Bottom Layer w0.152: v1(27.77,10.29) 27.77,10.52 28.03,10.77 CN4.1
G1: length 25.9
  Top Layer w0.152: v1(25.2,13.21) 25.2,12.6 U9.5 ; 7.32,6.28 7.61,6.57 v1(7.68,6.57) ; 7.32,6.28 7.32,5.49 7.33,5.48 7.54,5.48 ; 7.32,6.28 R41.1
  POWER w0.152: v2(20.93,11.14) 20.26,11.81 18.78,11.81 18.05,11.08 18.05,8.52 17.53,8 9.11,8 v1(7.68,6.57)
  Bottom Layer w0.152: v2(20.93,11.14) 21.21,11.41 23.83,11.41 24.61,12.2 24.61,12.63 v1(25.2,13.21)
G2: length 25.1
  Top Layer w0.152: Q3.4 9.87,4.18 10.09,4.39 R44.1 10.66,4.39 11.17,3.88 12.63,3.88 12.94,4.19 12.94,4.69 v1(13.5,5.26) ; v1(24.36,13.32) 24.75,13.72 U9.6
  POWER w0.152: v1(13.5,5.26) 15.15,5.26 18.3,8.41 18.3,10.62 v1(18.77,11.08)
  Bottom Layer w0.152: v1(18.77,11.08) 18.99,11.31 19.59,11.31 19.94,11.67 23.71,11.67 23.73,11.68 23.74,11.68 24.36,12.31 v1(24.36,13.32)
GPIO1: length 6.1
  Top Layer w0.152: R21.2 23.73,19.18 24.91,17.99 U3.1 v1(24.91,15.76)
  Bottom Layer w0.152: v1(24.91,15.76) 25.31,15.37 U1.7
GPIO5: length 41.2
  Top Layer w0.152: 28.43,6.68 28.11,6.36 v1(28.02,6.36) ; Q2.1 6.51,20.96 v1(6.51,21.72) R43.1
  POWER w0.152: v1(6.51,21.72) 6.51,19.75 7.34,18.92 7.34,18.17 5.65,16.48 5.65,10.32 v1(7.83,8.14)
  Bottom Layer w0.152: v1(28.02,6.36) 28.02,6.06 27.5,5.54 24.65,5.54 23.91,4.8 17.77,4.8 14.52,8.05 9.32,8.05 U1.16 8.24,7.75 7.84,8.14 v1(7.83,8.14)
GPIO6: length 16.7
  Top Layer w0.152: v1(21.06,23.5) R5.1 R9.2 19.47,22.91 19.03,22.48 C7.1
  Bottom Layer w0.152: v1(21.06,23.5) 21.06,19.69 21.37,19.38 21.37,15.57 22.84,14.1 U1.8
GPIO7: length 8.7
  Top Layer w0.152: 30.08,6.68 30.07,6.68 29.58,7.17 29.58,11.55 29.1,12.03 28.34,12.03 v1(27.63,12.74)
  Bottom Layer w0.152: U1.9 27.54,12.83 v1(27.63,12.74)
GPIO8: length 12.4
  Top Layer w0.152: 33.13,6.68 32.52,6.07 29.73,6.07 29.33,6.47 29.33,11.44 29,11.77 27.85,11.77 v1(27.67,11.95)
  Bottom Layer w0.152: v1(27.67,11.95) 27.27,11.56 U1.10
GPIO13: length 17
  Top Layer w0.152: USB1.7 17.25,6.47 17.07,6.3 16.42,6.3 16.25,6.47 USB1.5 16.25,8.19 15.86,8.59 D5.2 15.86,9.42 v1(16.24,9.81)
  Bottom Layer w0.152: U1.13 25.35,7.75 22.78,10.31 16.75,10.31 v1(16.24,9.81)
GPIO14: length 15.6
  Top Layer w0.152: 16.87,8.13 D2.2 16.87,9.44 v1(17.25,9.82) ; 16.87,8.13 16.75,8 USB1.6 ; 16.87,8.13 17.51,8.13 17.75,7.89 USB1.8
  Bottom Layer w0.152: U1.14 26.26,6.48 22.69,10.05 17.48,10.05 v1(17.25,9.82)
GPIO23: length 8.5
  Bottom Layer w0.152: X1.10 2.18,15.25 2.99,14.44 7.77,14.44 8.11,14.1 U1.21
GPIO24: length 8.4
  Bottom Layer w0.152: U1.23 7.47,16.64 6.59,15.75 X1.9
GPIO25: length 10.6
  Bottom Layer w0.152: X1.8 1.95,16.25 2.59,16.89 4.53,16.89 5.42,17.78 5.42,19.28 6.59,20.45 U1.26
GPIO26: length 10.9
  Bottom Layer w0.152: U1.27 7.5,21.72 5.16,19.38 5.16,17.88 4.43,17.14 2.48,17.14 2.09,16.75 X1.7
GPIO27: length 54.8
  Top Layer w0.152: v1(10.01,3.56) 10,3.54 v1(8.39,3.54) ; R11.2 v1(7.06,8.18)
  Bottom Layer w0.152: CN6.1 28.32,23.13 28.05,22.86 28.05,20.45 28.98,19.51 29.85,19.51 31.1,18.27 31.1,11.03 32.88,9.25 32.88,8.13 32.37,7.62 31.31,7.62 29.62,5.93 28.73,5.93 27.82,5.03 25.87,5.03 24.88,4.04 13.44,4.04 13.11,3.71 10.17,3.71 v1(10.01,3.56) ; v1(8.39,3.54) 8.25,3.54 7.77,4.02 7.77,5.79 7.06,6.5 v1(7.06,8.18) 7.06,9.61 7.73,10.29 U1.18
LCD_RST: length 10
  Top Layer w0.152: R35.2 4.76,15.57 4.04,14.85 v1(4.04,13.96)
  POWER w0.152: v1(2.27,12.42) 3.13,12.42 4.04,13.33 v1(4.04,13.96)
  Bottom Layer w0.152: X1.15 1.94,12.75 v1(2.27,12.42) ; X1.11 1.03,14.73 2.34,14.73 3.11,13.96 v1(4.04,13.96)
LEDK: length 4.7
  Top Layer w0.381: v1(4.68,18.42) 5.24,18.42 R30.2
  Bottom Layer w0.254: X1.2 2.32,19.25 3.16,18.42 v1(4.68,18.42)
MIC_3V3: length 3.3
  Top Layer w0.381: R3.1 C4.2 10.78,23.2 R7.2 R6.2
MIC_N: length 3.6
  Top Layer w0.152: CN1.2 7.78,19.38 7.98,19.18 R10.2
MIC_P: length 7.8
  Top Layer w0.152: C10.2 11.74,21.28 R7.1 10.78,21.21 10.34,20.77 9.96,20.77 9.76,20.57 9.76,20.23 C6.1 9.62,20.09 6.16,20.09 5.63,20.62 CN1.1
NS_PA_INN: length 2.3
  Top Layer w0.152: C22.1 R20.2 32.96,11.52 C18.1
NS_PA_INP: length 2.3
  Top Layer w0.152: C14.2 30.93,11.36 R17.2 C20.1
NS_PA_OUT+: length 6.9
  Top Layer w0.381: C15.1 26.87,18.2 24.91,20.15 U3.8
  Top Layer w0.508: CN2.1 28.37,19.38 28.18,19.18 C15.1
NS_PA_OUT-: length 3.3
  Top Layer w0.381: U3.5 27.15,21.2 27.76,21.81 C19.2
  Top Layer w0.508: C19.2 28.18,20.95 28.51,20.62 CN2.2
SCK/SCL: length 16.9
  Top Layer w0.152: v1(10.79,9.05) 10.79,8.78 10.65,8.64 CN3.2 ; R32.2 21.33,9.4 v1(21.5,9.56) 21.5,10.54 22,11.05 23.1,11.05 23.22,10.92 23.22,10.47 23.22,10.46
  POWER w0.152: v1(19.72,8.46) 20.82,9.56 v1(21.5,9.56)
  Bottom Layer w0.152: v1(19.72,8.46) 19.2,7.94 15.71,7.94 14.83,8.81 11.03,8.81 v1(10.79,9.05)
SDI/SDA: length 18.4
  Top Layer w0.152: 23.72,10.46 23.72,10.93 23.35,11.3 21.9,11.3 21.01,10.41 R31.2 20.86,10.49 20.3,11.05 19.67,11.05 19.41,10.8 19.41,8.86 v1(19.01,8.45) ; CN3.4 10.43,10.92 v1(11.21,10.92)
  Bottom Layer w0.152: v1(19.01,8.45) 18.75,8.19 15.81,8.19 14.94,9.07 13.14,9.07 11.29,10.92 v1(11.21,10.92)
SDO: length 22.6
  Top Layer w0.152: CN3.3 9.76,9.91 v1(10.17,9.5) ; U10.4 24.86,6.08 v1(24.66,6.29) 23.74,6.29 R38.2
  Bottom Layer w0.152: v1(24.66,6.29) 22.8,8.14 20.44,8.14 19.99,7.69 15.6,7.69 14.73,8.56 10.6,8.56 10.17,8.99 v1(10.17,9.5)
VOUT: length 52
  Top Layer w0.305: 26.22,21.2 26.22,22.51 C23.2
  Top Layer w0.381: v1(14.84,11.05) 14.84,11.33 D4.1 ; Q4.3 11.53,15.12 12.56,14.1 12.56,13.12 C39.2
  Top Layer w0.508: Q4.3 12.25,15.24 v1(12.38,15.37) 14.23,15.37 14.55,15.05 U4.4 15.8,15.05 16.37,14.48 16.37,13.72 16.93,13.15 17.66,13.15 ; C23.2 C24.2 27.67,23.62 28.05,24 v1(28.56,24)
  POWER w0.508: v1(28.56,24) 29.08,23.48 v1(29.08,18.16) 27.67,18.16 26.4,19.43 23.48,19.43 22.82,18.78 17.33,18.78 15.32,16.77 13.44,16.77 12.38,15.7 v1(12.38,15.37) 12.38,14.14 14.84,11.68 v1(14.84,11.05)
  Bottom Layer w0.381: CN5.1 v1(29.08,18.16)
  Bottom Layer w0.508: v1(28.56,24) 30.21,24 30.59,23.62 30.59,22.48 30.24,22.13 CN6.2
$1N2273: length 1.9
  Top Layer w0.381: 17.66,15.05 19.39,15.05 L1.2
$1N2274: length 3.8
  Top Layer w0.254: R29.1 17.58,11.68 R25.2
  Top Layer w0.381: R29.1 16.67,12.52 16.04,13.15 15.06,13.15
$1N6219: length 2.8
  Top Layer w0.152: R24.2 14.84,9.02 15.75,8.11 USB1.4
$1N6296: length 2.7
  Top Layer w0.152: R27.2 18.91,9.04 18.52,8.66 18.52,8.51 18.53,8.51 18.53,8.25 18.75,8.03 USB1.10
$1N16726: length 1.9
  Top Layer w0.152: U8.8 U8.7 22.72,13.47 23.35,14.1 23.35,14.3
$1N17113: length 6
  Top Layer w0.254: 21.84,4.58 21.41,4.58 v1(20.25,3.43) ; 21.84,4.58 U10.8 ; 21.84,4.58 21.84,4.97 21.95,5.08 22.63,5.08 U10.7
  Bottom Layer w0.152: R40.1 20.25,1.55 20.25,3.37 20.23,3.39 20.23,3.4 v1(20.25,3.43)
$1N47248: length 9.7
  Top Layer w0.152: U7.6 10.58,2.73 11.06,3.21 v1(11.09,3.21)
  Bottom Layer w0.152: v1(11.09,3.21) 11.34,3.45 13.21,3.45 13.54,3.78 18.04,3.78 18.73,3.1 R34.1
$1N47251: length 2
  Bottom Layer w0.152: 14.64,1.52 15.44,0.72 LED1.2
$1N51543: length 15.8
  Top Layer w0.152: 20.87,16.5 20.87,17.22 v1(20.84,17.25) 21.57,17.98 21.57,19.33 R26.1 ; Q4.1 13.35,14.29 v1(13.11,14.53)
  Bottom Layer w0.152: v1(13.11,14.53) 13.11,16.43 14.71,18.03 16.37,18.03 16.75,18.42 18.65,18.42 19.82,17.25 v1(20.84,17.25)
$1N51545: length 22.5
  Top Layer w0.152: U5.4 v1(18.97,17.4)
  POWER w0.152: v1(25.81,2.48) 25.81,3.26 25.51,3.56 24.75,3.56 23.47,4.83 23.47,10.07 20.71,12.83 19.79,12.83 18.97,13.65 v1(18.97,17.4)
  Bottom Layer w0.152: v1(25.81,2.48) 25.93,2.35 SW2.4 27.41,2.76 NOREF.1
$1N53905: length 1.8
  Bottom Layer w0.152: R37.2 15.27,2.11 15.81,1.57 LED1.1
$2N12642: length 6.7
  Top Layer w0.152: 32.11,14.66 31.25,15.52 27.39,15.52 26.87,16.04 U3.4
$2N12643: length 6.3
  Top Layer w0.152: 31.1,14.66 30.49,15.27 27.01,15.27 26.22,16.06 26.22,16.9
$2N12644: length 4.2
  Top Layer w0.152: U3.2 25.56,17.7 23.86,19.41 23.86,19.69 23.35,20.19
$2N12647: length 1.1
  Top Layer w0.152: R23.1 32.28,13.63 C22.2
$2N12648: length 1.1
  Top Layer w0.152: R22.1 30.93,13.63 C20.2
$2N12678: length 2.4
  Top Layer w0.152: R16.1 R15.2 30.25,7.55 C12.2
$2N12679: length 2.2
  Top Layer w0.152: C13.2 30.81,10.49 R17.1 R16.2
$2N12680: length 2.4
  Top Layer w0.152: C16.1 32.96,7.55 R18.2 R19.1
$2N12681: length 2.2
  Top Layer w0.152: C17.1 32.4,10.2 32.7,10.49 R20.1 R19.2
$2N12692: length 3.8
  Top Layer w0.152: R3.2 12.86,22.22 R8.2 13.88,22.15 13.95,22.22 C5.2 13.95,22.48 14.27,22.79 U2.1
$2N12693: length 6.4
  Top Layer w0.152: U2.3 15.19,19.93 C1.1 R4.1 14.08,19.86 14.08,20.32 13.82,20.57 11.28,20.57 10.9,20.19 C6.2
$2N12697: length 8.5
  Top Layer w0.152: v1(12.87,19.24) 12.87,19.42 13.26,19.81 ; 19.03,21.3 19.03,21.21 18.72,20.89 U2.4 16.81,20.89 v1(16.4,20.48) C1.2
  Bottom Layer w0.152: v1(12.87,19.24) 14.12,20.48 v1(16.4,20.48)

## Copper pours and planes (outline as drawn; the poured copper is in the pictures)
GND on Top Layer: 0,24.43 34.02,24.43 34.02,0 0,0
GND on Bottom Layer: 0,24.43 34.02,24.43 34.02,0 0,0
GND on GND: 0,24.43 34.02,24.43 34.02,0 0,0
GND on POWER: 0,24.43 34.02,24.43 34.02,0 0,0

Small or netless copper shapes (teardrops, artwork), in the pictures only: 324 on Top Layer, 115 on Bottom Layer, 4 on GND, 26 on POWER

## Text on the board
Bottom Silkscreen Layer: 27 | 18 | BOOT | PWR | I2C | EXT | RGB | 3 | 2 | 5 | 4 | V | G | TX | RX | LCD | Shuttle | ESP-Sensair
Top Silkscreen Layer: 1V8 | 3V3 | + | - | MIC | BAT | SPK
